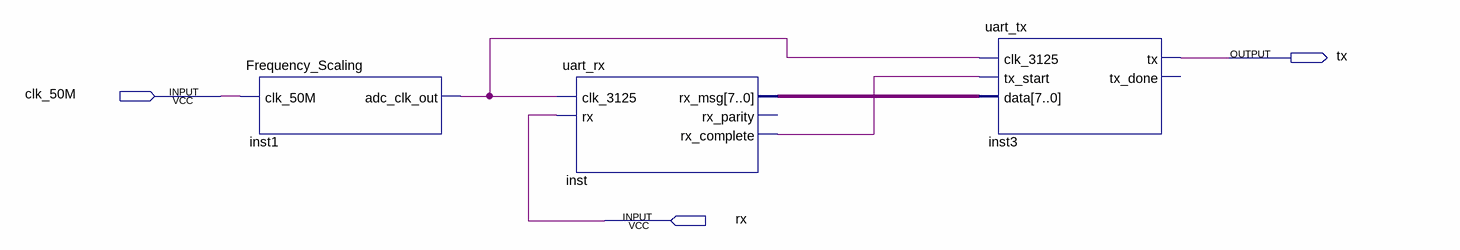
[diagram p0: schematic sheet]
// Quartus schematic UART.bdf as structural Verilog: 3 symbols, 3 pins
module UART (
  input  clk_50M,
  input  rx,
  output tx
);

  wire inst1_adc_clk_out, inst_rx_complete;
  wire [7:0] inst_rx_msg;

  Frequency_Scaling inst1 (.clk_50M(clk_50M), .adc_clk_out(inst1_adc_clk_out));
  uart_rx inst (
    .clk_3125(inst1_adc_clk_out), .rx(rx), .rx_msg(inst_rx_msg), .rx_complete(inst_rx_complete));  // open: rx_parity
  uart_tx inst3 (
    .clk_3125(inst1_adc_clk_out), .tx_start(inst_rx_complete), .data(inst_rx_msg), .tx(tx));  // open: tx_done
endmodule
